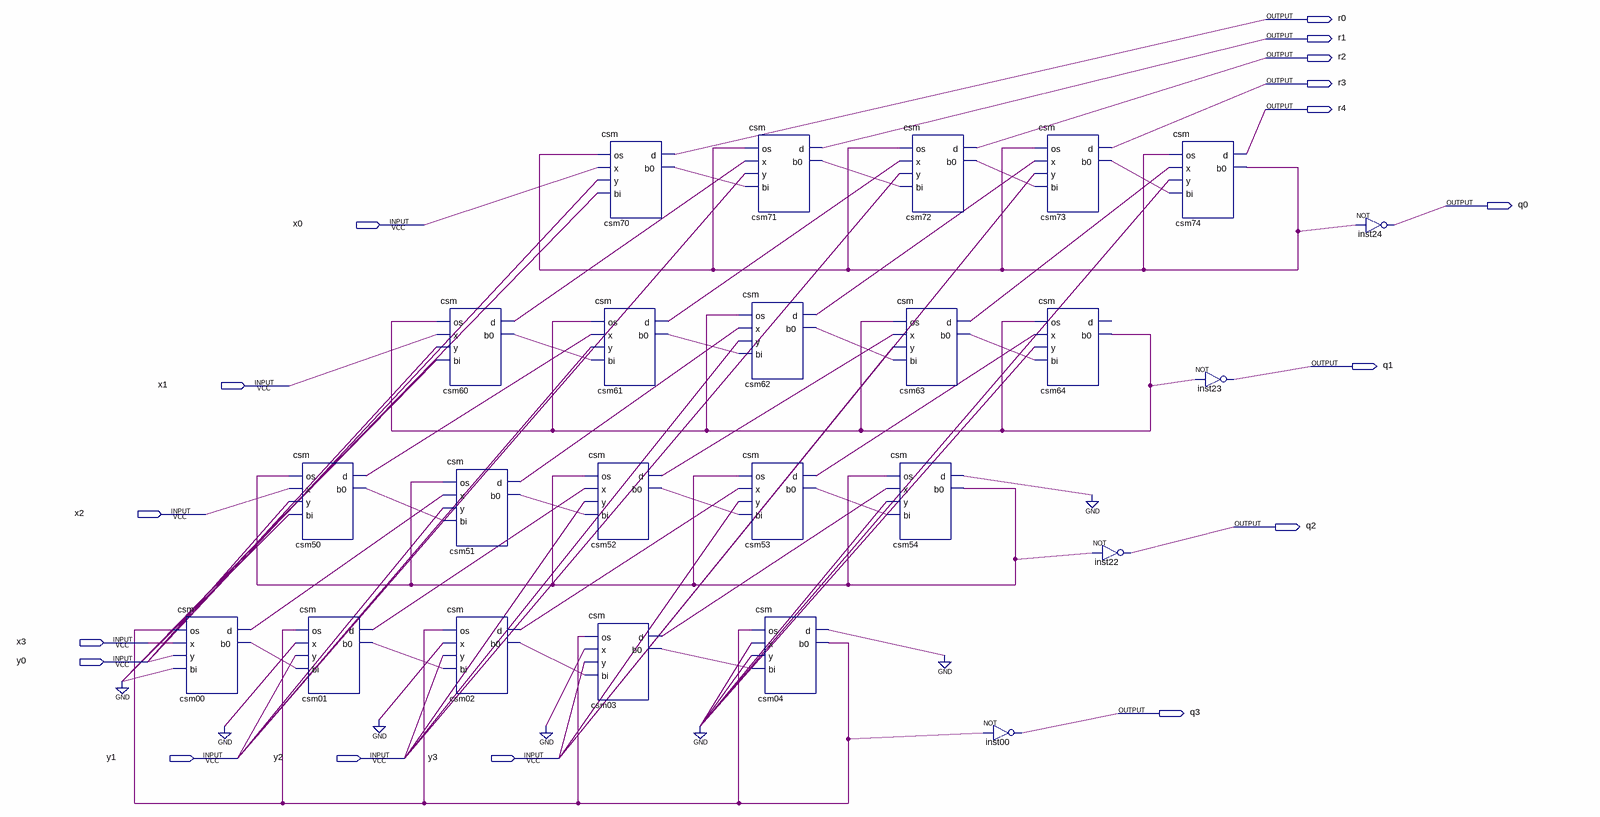
[diagram p0: schematic sheet]
// Quartus schematic circuitodivisor.bdf as structural Verilog: 24 symbols, 17 pins
module circuitodivisor (
  input  x0,
  input  x1,
  input  x2,
  input  x3,
  input  y0,
  input  y1,
  input  y2,
  input  y3,
  output r0,
  output r1,
  output r2,
  output r3,
  output r4,
  output q0,
  output q1,
  output q2,
  output q3
);

  wire csm00_b0, csm00_d, csm01_b0, csm01_d, csm02_b0, csm02_d, csm03_b0, csm03_d, csm04_b0, csm04_d,
       csm50_b0, csm50_d, csm51_b0, csm51_d, csm52_b0, csm52_d, csm53_b0, csm53_d, csm54_b0, csm54_d,
       csm60_b0, csm60_d, csm61_b0, csm61_d, csm62_b0, csm62_d, csm63_b0, csm63_d, csm64_b0, csm70_b0,
       csm71_b0, csm72_b0, csm73_b0, csm74_b0;

  csm csm00 (.os(csm04_b0), .x(x3), .y(y0), .bi(1'b0), .d(csm00_d), .b0(csm00_b0));
  csm csm50 (.os(csm54_b0), .x(x2), .y(y0), .bi(1'b0), .d(csm50_d), .b0(csm50_b0));
  csm csm01 (.os(csm04_b0), .x(1'b0), .y(y1), .bi(csm00_b0), .d(csm01_d), .b0(csm01_b0));
  csm csm60 (.os(csm64_b0), .x(x1), .y(y0), .bi(1'b0), .d(csm60_d), .b0(csm60_b0));
  csm csm51 (.os(csm54_b0), .x(csm00_d), .y(y1), .bi(csm50_b0), .d(csm51_d), .b0(csm51_b0));
  csm csm02 (.os(csm04_b0), .x(1'b0), .y(y2), .bi(csm01_b0), .d(csm02_d), .b0(csm02_b0));
  csm csm70 (.os(csm74_b0), .x(x0), .y(y0), .bi(1'b0), .d(r0), .b0(csm70_b0));
  csm csm61 (.os(csm64_b0), .x(csm50_d), .y(y1), .bi(csm60_b0), .d(csm61_d), .b0(csm61_b0));
  csm csm52 (.os(csm54_b0), .x(csm01_d), .y(y2), .bi(csm51_b0), .d(csm52_d), .b0(csm52_b0));
  csm csm03 (.os(csm04_b0), .x(1'b0), .y(y3), .bi(csm02_b0), .d(csm03_d), .b0(csm03_b0));
  csm csm71 (.os(csm74_b0), .x(csm60_d), .y(y1), .bi(csm70_b0), .d(r1), .b0(csm71_b0));
  csm csm62 (.os(csm64_b0), .x(csm51_d), .y(y2), .bi(csm61_b0), .d(csm62_d), .b0(csm62_b0));
  csm csm53 (.os(csm54_b0), .x(csm02_d), .y(y3), .bi(csm52_b0), .d(csm53_d), .b0(csm53_b0));
  csm csm04 (.os(csm04_b0), .x(1'b0), .y(1'b0), .bi(csm03_b0), .d(csm04_d), .b0(csm04_b0));
  csm csm72 (.os(csm74_b0), .x(csm61_d), .y(y2), .bi(csm71_b0), .d(r2), .b0(csm72_b0));
  csm csm63 (.os(csm64_b0), .x(csm52_d), .y(y3), .bi(csm62_b0), .d(csm63_d), .b0(csm63_b0));
  csm csm54 (.os(csm54_b0), .x(csm03_d), .y(1'b0), .bi(csm53_b0), .d(csm54_d), .b0(csm54_b0));
  not inst00 (q3, csm04_b0);
  csm csm73 (.os(csm74_b0), .x(csm62_d), .y(y3), .bi(csm72_b0), .d(r3), .b0(csm73_b0));
  csm csm64 (.os(csm64_b0), .x(csm53_d), .y(1'b0), .bi(csm63_b0), .b0(csm64_b0));  // open: d
  not inst22 (q2, csm54_b0);
  csm csm74 (.os(csm74_b0), .x(csm63_d), .y(1'b0), .bi(csm73_b0), .d(r4), .b0(csm74_b0));
  not inst23 (q1, csm64_b0);
  not inst24 (q0, csm74_b0);
  // also tied to GND on the sheet: {csm04_d, csm54_d}
endmodule
